# EAGLE design mpg_LINUXCNC (EAGLE 7.5.0)
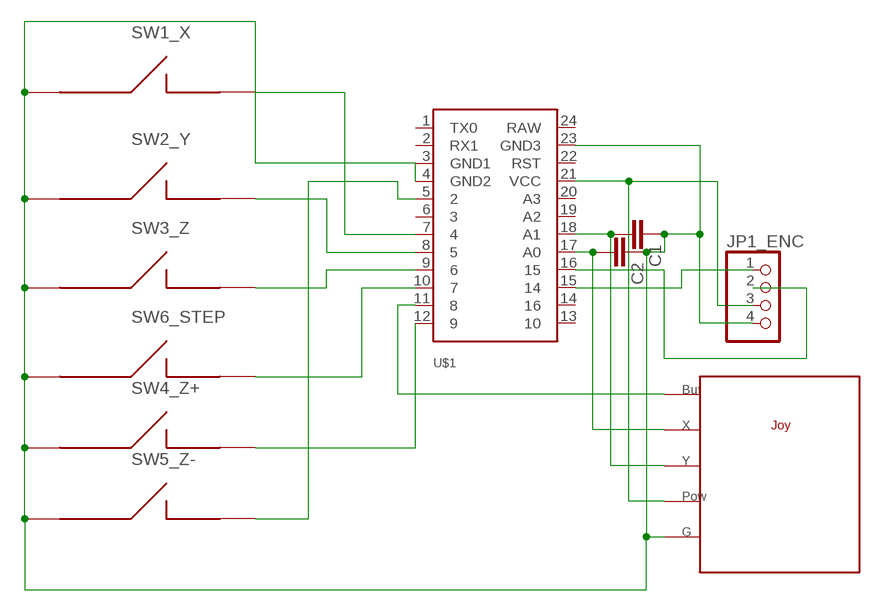
[diagram p0: schematic, sheet 1]

## Parts
C1  C-EUC0805  [C0805]
C2  C-EUC0805  [C0805]
JOY1  JOY  [JOY]
JP1_ENC  PINHD-1X4  [1X04]
SW1_X  B2  [B2]
SW2_Y  B2  [B2]
SW3_Z  B2  [B2]
SW4_Z+  B1  [B1]
SW5_Z-  B1  [B1]
SW6_STEP  B1  [B1]
U$1  ARDUINOPROMICRO1  [PROMICRO]

## Nets
GND: C1.1 C2.1 JOY1.P$5 JP1_ENC.4 SW1_X.P$1 SW1_X.P$3 SW2_Y.P$1 SW2_Y.P$3 SW3_Z.P$1 SW3_Z.P$3 SW4_Z+.P$1 SW4_Z+.P$3 SW5_Z-.P$1 SW5_Z-.P$3 SW6_STEP.P$1 SW6_STEP.P$3 U$1.3(GND1) U$1.4(GND2) U$1.23(GND3)
N$1: SW1_X.P$2 SW1_X.P$4 U$1.7
N$2: SW2_Y.P$2 SW2_Y.P$4 U$1.8
N$3: SW3_Z.P$2 SW3_Z.P$4 U$1.9
N$4: SW6_STEP.P$2 SW6_STEP.P$4 U$1.10
N$5: SW5_Z-.P$2 SW5_Z-.P$4 U$1.5
N$6: JOY1.P$1 U$1.11
N$7: C2.2 JOY1.P$2 U$1.17(A0)
N$8: C1.2 JOY1.P$3 U$1.18(A1)
N$9: JOY1.P$4 JP1_ENC.3 U$1.21(VCC)
N$10: SW4_Z+.P$2 SW4_Z+.P$4 U$1.12
N$16: JP1_ENC.1 U$1.15
N$17: JP1_ENC.2 U$1.16
Unconnected: U$1.1(TX0) U$1.2(RX1) U$1.6 U$1.13 U$1.14 U$1.19(A2) U$1.20(A3) U$1.22(RST) U$1.24(RAW)

## Library data of the parts
C1 C2 = rcl:C-EU: CAPACITOR, European symbol
JOY1 = Buttons:JOY
JP1_ENC = pinhead:PINHD-1X4: PIN HEADER
SW1_X SW2_Y SW3_Z = Buttons:B2: Кнопка с резиновой пимкой Рассиряние между падами 8.1х4.4
SW4_Z+ SW5_Z- SW6_STEP = Buttons:B1
U$1 = ProMicro:ARDUINOPROMICRO

## Board
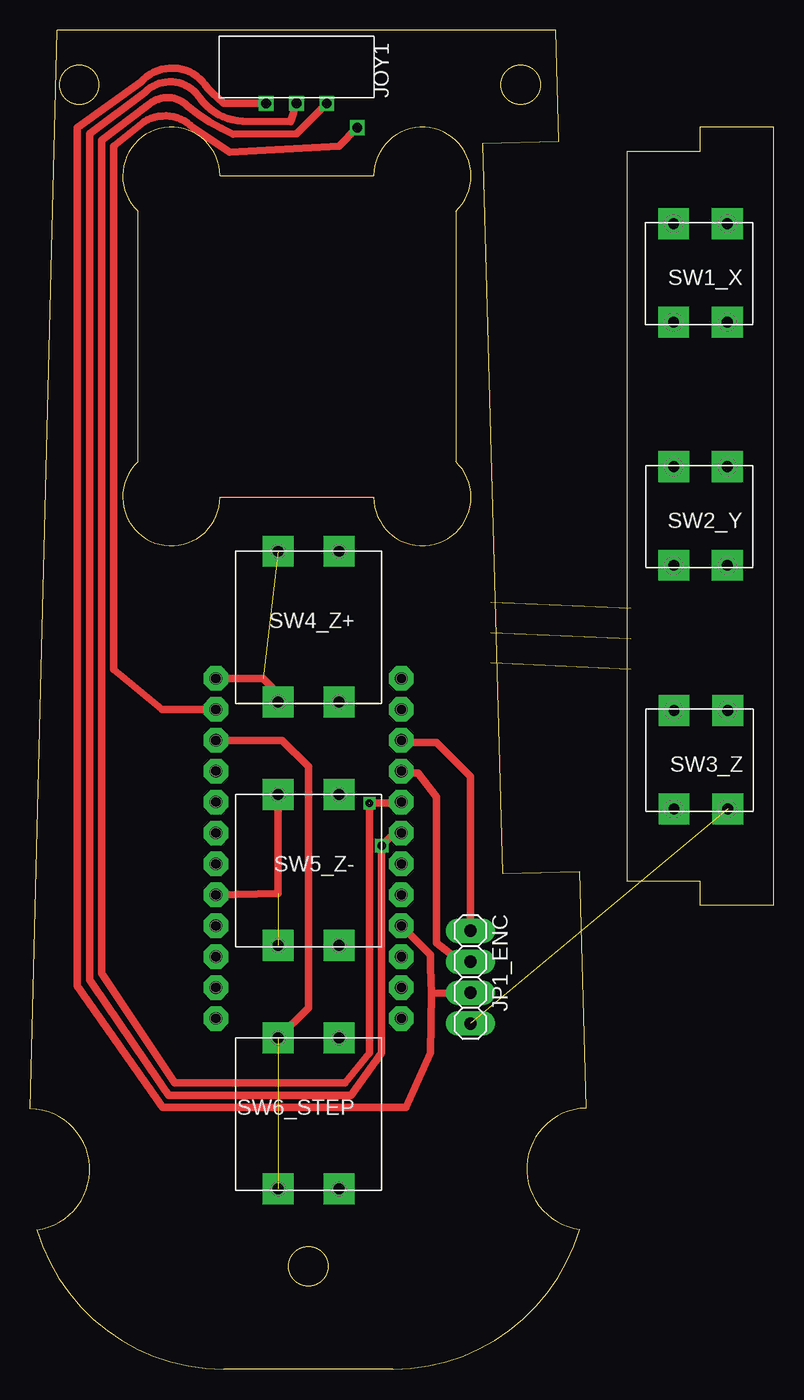
[diagram p1: board, top side]
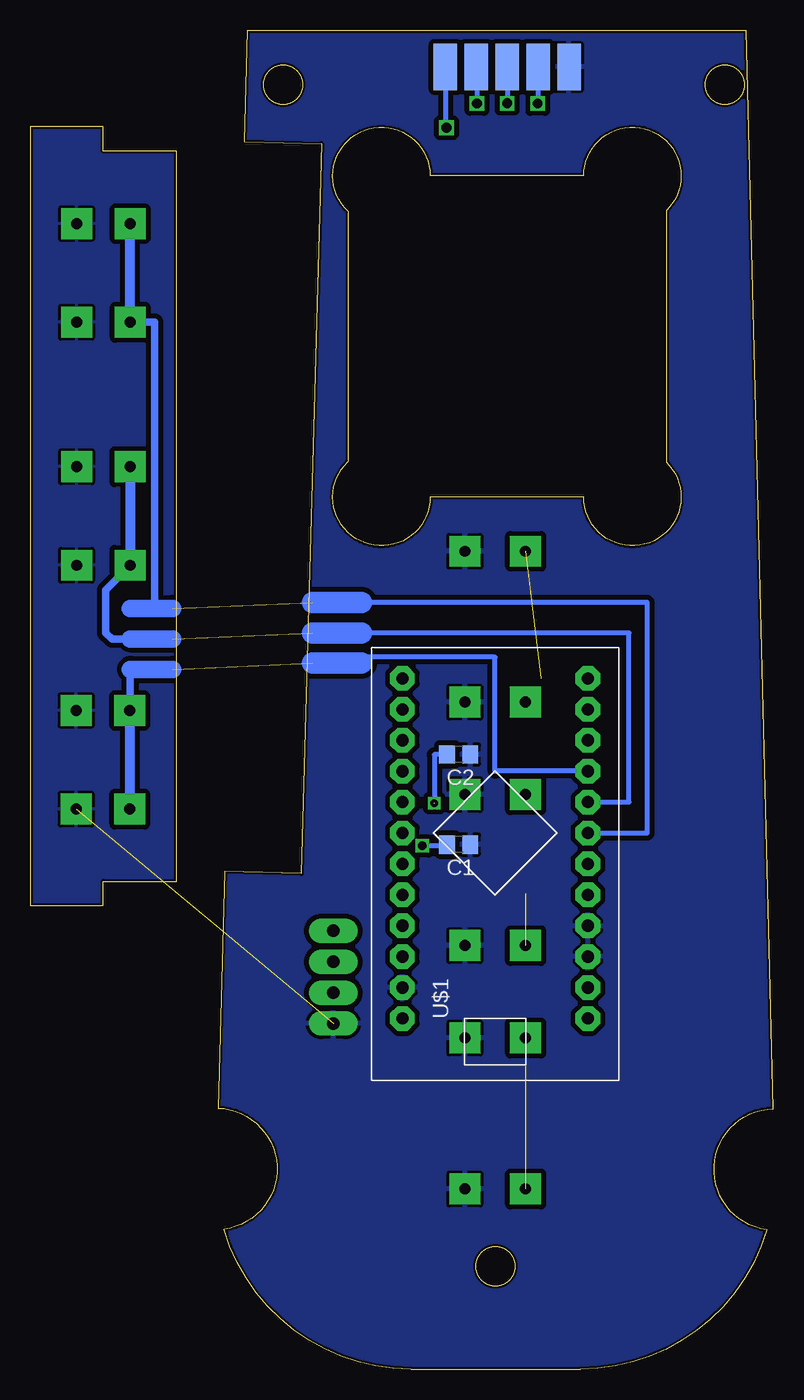
[diagram p2: board, bottom side, seen from below]

Size 61.06 x 110 mm. Coordinates in mm from the lower left corner, seen from the top.
Outline: 0,21.4 0,21.4
Outline: 0,21.4 2.21,110 43.2,110 43.45,100.87 37.15,100.69 38.82,40.72 45.11,40.89 45.66,21.44 arc171 45.15,11.49 arc-74 29.8,0 15.87,0 arc-73 0.53,11.44 arc171 0,21.4
Outline: 15.58,71.65 15.58,71.65
Outline: 15.58,71.65 28.21,71.65 arc227 34.96,74.56 34.96,95.15 arc227 28.21,98.05 15.58,98.05 arc226 8.81,95.17 8.81,74.53 arc226 15.58,71.65
Outline: 55.06,102.09 61.06,102.09 61.06,38.09 55.06,38.09 55.06,40.09 49.06,40.09 49.06,100.09 55.06,100.09 55.06,102.09
Outline: circle at 4,105.55 radius 1.6
Outline: circle at 22.84,8.44 radius 1.6
Outline: circle at 40.29,105.55 radius 1.6
Copper layers (1*16): Top 0.035mm / dielectric 0.5mm / Bottom 0.035mm
Design rules "default *": minimum track width 10mil, minimum drill 24mil, track to track 16mil, track to pad 16mil, pad to pad 8mil, via to via 8mil, smd to smd 8mil, copper to edge 8mil, drill to drill 16mil, minimum pad ring 20mil, minimum via ring 8mil, stop-mask expansion 4mil, vias tented up to drill 0mil, thermal gap 10mil

### Footprints (pad centres in the part's own frame; a part is rotated, then mirrored left to right if it is on the bottom)
C0805 = smd 1.3 x 1.5: 1 -0.95,0; 2 0.95,0
JOY = smd 3.81 x 1.93 bottom: P$1 0,0; P$2 0,2.54; P$3 0,5.08; P$4 0,7.62; P$5 0,10.16
1X04 = drill 1.016 long: 1 -3.81,0; 2 -1.27,0; 3 1.27,0; 4 3.81,0
B2 = drill 0.9 pad 2.54 square: P$1 0,0; P$2 4.4,0; P$3 0,8.1; P$4 4.4,8.1
B1 = drill 0.9 pad 2.54 square: P$1 0,0; P$2 5,0; P$3 0,12.4; P$4 5,12.4
PROMICRO = drill 1 pad 1.93 octagon: 1 0,0; 2 2.54,0; 3 5.08,0; 4 7.62,0; 5 10.16,0; 6 12.7,0; 7 15.24,0; 8 17.78,0; 9 20.32,0; 10 22.86,0; 11 25.4,0; 12 27.94,0; 13 27.94,15.24; 14 25.4,15.24; 15 22.86,15.24; 16 20.32,15.24; 17 17.78,15.24; 18 15.24,15.24; 19 12.7,15.24; 20 10.16,15.24; 21 7.62,15.24; 22 5.08,15.24; 23 2.54,15.24; 24 0,15.24

### Placement (x,y rotation side)
C1  25.86,43.1 180 bottom
C2  25.86,50.5 180 bottom
JOY1  26.95,107 90 top
JP1_ENC  36.16,32.2 270 top
SW1_X  57.26,94.12 180 top
SW2_Y  57.27,74.15 180 top
SW3_Z  57.3,54.12 180 top
SW4_Z+  25.36,67.2 180 top
SW5_Z-  25.36,47.2 180 top
SW6_STEP  25.36,27.2 180 top
U$1  15.24,28.81 90 bottom

### Tracks (layer width: path | path; a pad name or v marks a point on that pad's centre or on a via)
GND  (1 unrouted)
  pour Bottom: 45.86,105 63.86,105 63.86,34 45.86,34
  pour Bottom: -5.64,112.5 46.36,112.5 46.36,-4 -5.14,-4 -5.14,112
N$1  (1 unrouted)
  Bottom 0.406: U$1.7 10.36,44.05 10.36,63 33.86,63
  Bottom 0.61: SW1_X.P$4 50.86,86.02 50.86,62.5
  Bottom 0.813: SW1_X.P$4 SW1_X.P$2
  Bottom 1.422: 49.36,62.5 50.86,62.5 52.86,62.5
  Bottom 1.778: 33.86,63 37.86,63
N$2  (1 unrouted)
  Bottom 0.406: U$1.8 11.86,46.59 11.86,60.5 33.86,60.5 | SW2_Y.P$4
  Bottom 0.61: SW2_Y.P$4 52.86,66 54.86,64 54.86,60.5 54.36,60 52.86,60
  Bottom 0.813: SW2_Y.P$2 SW2_Y.P$4
  Bottom 1.422: 52.86,60 49.36,60
  Bottom 1.778: 33.86,60.5 37.86,60.5
N$3  (1 unrouted)
  Bottom 0.406: U$1.9 22.86,49.13 22.86,58.5 33.86,58.5 33.86,58 | SW3_Z.P$2 52.86,54.12
  Bottom 0.61: 52.86,54.12 52.86,57.5
  Bottom 0.813: SW3_Z.P$2 SW3_Z.P$4
  Bottom 1.422: 52.86,57.5 49.36,57.5
  Bottom 1.778: 33.86,58 37.86,58
N$4  (1 unrouted)
  Top 0.61: U$1.10 20.69,51.67 22.86,49.5 22.86,29.7 SW6_STEP.P$2
N$5  (1 unrouted)
  Top 0.61: SW5_Z-.P$2 20.36,39.09 U$1.5
N$6  (via drill 0.8)
  Top 0.61: v26.86,102 25.36,100.5 16.36,100 13.36,102 arc77 9.36,102.5 6.86,100.5 6.86,57.5 10.81,54.2 U$1.11
  Bottom 0.406: JOY1.P$1 26.95,102.09 v26.86,102
N$7  (via drill 0.6, 0.8)  (1 unrouted)
  Top 0.61: v24.36,104 21.86,101.5 16.66,101.47 arc-16 12.91,103.78 arc90 9.61,103.81 5.86,101 5.86,32.5 11.86,23.5 25.86,23.5 27.86,26 27.86,46.47 | v27.86,46.5 30.48,46.5 U$1.17
  Bottom 0.406: JOY1.P$2 24.36,106.95 v24.36,104 | C2.2 27.86,50.5 v27.86,46.5
N$8  (via drill 0.7, 0.8)
  Top 0.61: v21.87,104.01 21.36,102.5 17.44,102.53 arc-51 13.94,104.42 arc104 9.44,104.92 4.86,101.5 4.86,32 11.36,22.5 26.36,22.5 28.86,26 v28.86,43 29.91,44.05 U$1.18
  Bottom 0.406: JOY1.P$3 v21.87,104.01 | C1.2 26.91,43 v28.86,43
N$9  (via drill 0.8)
  Top 0.61: JP1_ENC.3 34.43,30.93 32.97,30.88 | U$1.21 32.86,34.05 32.86,33 32.97,30.88 | v19.36,104 15.86,104 arc-1 14.56,105.25 arc107 9.06,105.75 3.86,102 3.86,31.5 10.86,21.5 30.86,21.5 32.86,26 32.97,30.88
  Bottom 0.406: JOY1.P$4 19.33,104.53 19.36,104.5 v19.36,104
N$10  (1 unrouted)
  Top 0.61: U$1.12 19.11,56.75 19.86,56 19.86,55.3 SW4_Z+.P$4
N$16
  Top 0.61: JP1_ENC.1 36.16,48.7 33.36,51.5 30.65,51.5 U$1.15
N$17
  Top 0.61: JP1_ENC.2 35.39,33.47 33.36,35 33.36,47 31.86,49 30.61,49 U$1.16